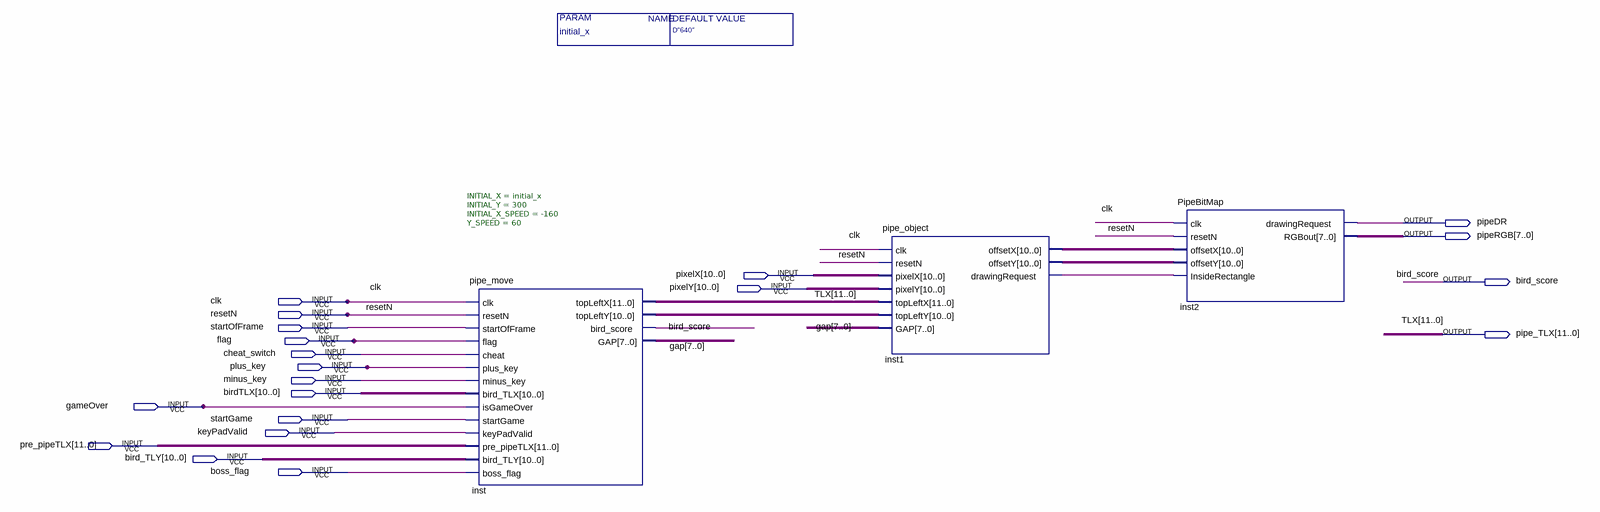
[diagram p0: schematic sheet]
// Quartus schematic pipe_block_T.bdf as structural Verilog: 3 symbols, 20 pins
module pipe_block_T #(parameter initial_x = "D\"640\"") (
  input  [10:0] pixelX,
  input  [10:0] pixelY,
  input  clk,
  input  resetN,
  input  startOfFrame,
  input  flag,
  input  cheat_switch,
  input  plus_key,
  input  minus_key,
  input  [10:0] birdTLX,
  input  gameOver,
  input  startGame,
  input  keyPadValid,
  input  [11:0] pre_pipeTLX,
  input  [10:0] bird_TLY,
  input  boss_flag,
  output pipeDR,
  output [7:0] pipeRGB,
  output bird_score,
  output [11:0] pipe_TLX
);

  wire inst1_drawingrequest;
  wire [7:0] gap;
  wire [10:0] inst1_offsetx, inst1_offsety, inst_toplefty;

  pipe_move #(.INITIAL_X(initial_x), .INITIAL_Y(300), .INITIAL_X_SPEED(-160), .Y_SPEED(60)) inst (
    .clk(clk), .resetN(resetN), .startOfFrame(startOfFrame), .flag(flag), .cheat(cheat_switch),
    .plus_key(plus_key), .minus_key(minus_key), .bird_TLX(birdTLX), .isGameOver(gameOver),
    .startGame(startGame), .keyPadValid(keyPadValid), .pre_pipeTLX(pre_pipeTLX), .bird_TLY(bird_TLY),
    .boss_flag(boss_flag), .topLeftX(pipe_TLX), .topLeftY(inst_toplefty), .bird_score(bird_score), .GAP(gap));
  pipe_object inst1 (
    .clk(clk), .resetN(resetN), .pixelX(pixelX), .pixelY(pixelY), .topLeftX(pipe_TLX),
    .topLeftY(inst_toplefty), .GAP(gap), .offsetX(inst1_offsetx), .offsetY(inst1_offsety),
    .drawingRequest(inst1_drawingrequest));
  PipeBitMap inst2 (
    .clk(clk), .resetN(resetN), .offsetX(inst1_offsetx), .offsetY(inst1_offsety),
    .InsideRectangle(inst1_drawingrequest), .drawingRequest(pipeDR), .RGBout(pipeRGB));

  // Other names for the same wires on the sheet: TLX[11:0] = pipe_TLX
endmodule
